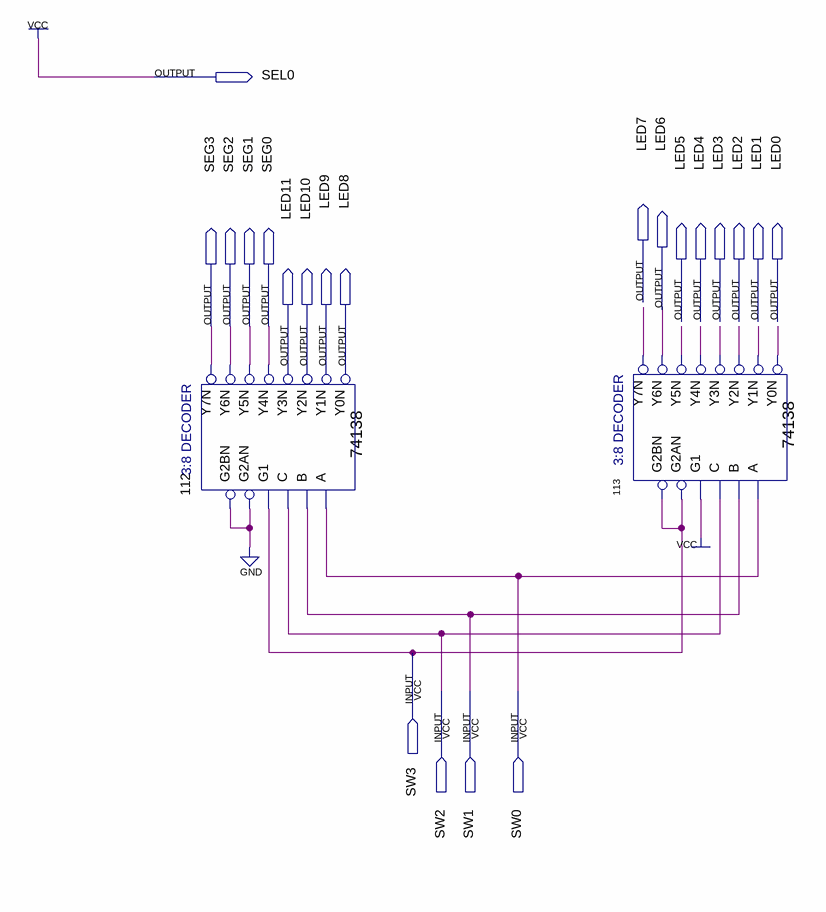
[diagram p0: schematic sheet]
// Quartus schematic ymq_4_16.bdf as structural Verilog: 2 symbols, 21 pins
module ymq_4_16 (
  input  SW3,
  input  SW2,
  input  SW1,
  input  SW0,
  output SEL0,
  output LED7,
  output LED6,
  output SEG3,
  output SEG2,
  output SEG1,
  output SEG0,
  output LED5,
  output LED4,
  output LED3,
  output LED2,
  output LED1,
  output LED0,
  output LED11,
  output LED10,
  output LED9,
  output LED8
);

  \74138  u_112 (
    .A(SW0), .B(SW1), .G1(SW3), .C(SW2), .G2AN(1'b0), .G2BN(1'b0), .Y0N(LED8), .Y1N(LED9), .Y2N(LED10),
    .Y3N(LED11), .Y4N(SEG0), .Y5N(SEG1), .Y6N(SEG2), .Y7N(SEG3));
  \74138  u_113 (
    .A(SW0), .B(SW1), .G1(1'b1), .C(SW2), .G2AN(SW3), .G2BN(SW3), .Y0N(LED0), .Y1N(LED1), .Y2N(LED2),
    .Y3N(LED3), .Y4N(LED4), .Y5N(LED5), .Y6N(LED6), .Y7N(LED7));

  assign SEL0 = 1'b1;
endmodule
